# Altium project driver4ch.PrjPcb
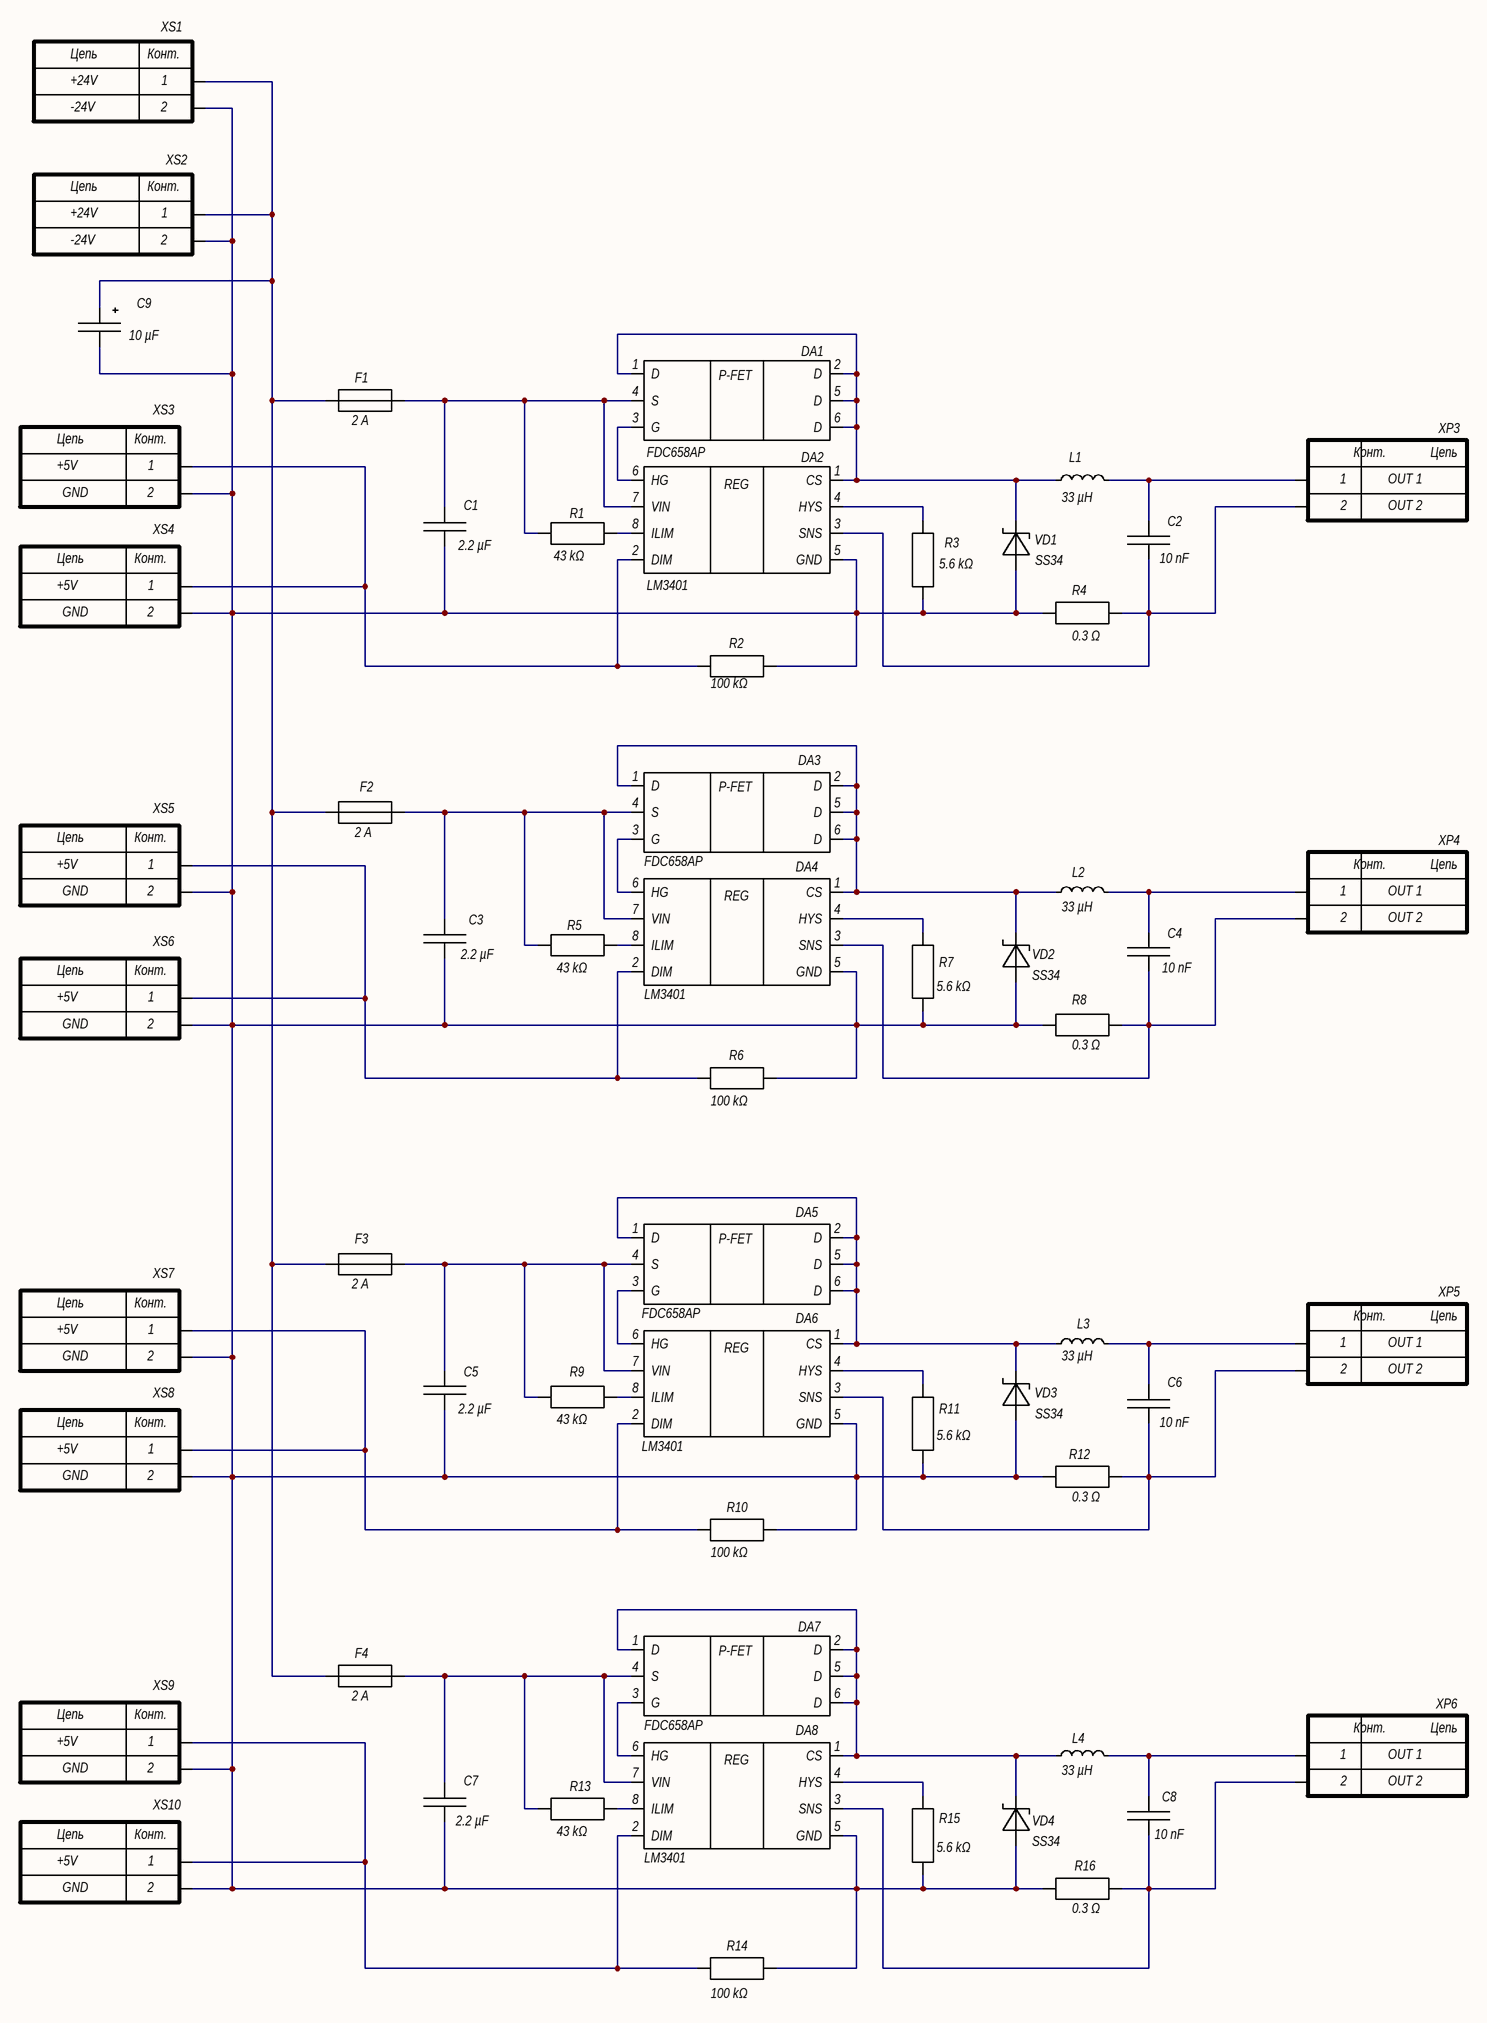
[diagram p0: driver4ch_E3_schematic.SchDoc]
1 sheet, 59 parts. Net scope: global (net labels, ports and power ports of the same name join across sheets).
Board file: driver4ch.PcbDoc

## Sheet driver4ch_E3_schematic.SchDoc
size 594 x 420 mm; CheckedBy: Нагорный А.В.; Author: Советников М.М.; CompanyName: ООО "Аксима"; Organization: ООО "Аксима"; SheetNumber: 1; SheetTotal: 1; Name1: 4-х канальный; Name2: драйвер

### Parts
C1  2.2 µF  [CAP 0805_2012 RF]
C2  10 nF  [CAP 0805_2012 RF]
C3  2.2 µF  [CAP 0805_2012 RF]
C4  10 nF  [CAP 0805_2012 RF]
C5  2.2 µF  [CAP 0805_2012 RF]
C6  10 nF  [CAP 0805_2012 RF]
C7  2.2 µF  [CAP 0805_2012 RF]
C8  10 nF  [CAP 0805_2012 RF]
C9  10 µF  [CAP ALSMD 6.6MM H5.4MM]
DA1  FDC658AP  [TI TSOT-23-6]
DA2  LM3401  [MSOP8]
DA3  FDC658AP  [TI TSOT-23-6]
DA4  LM3401  [MSOP8]
DA5  FDC658AP  [TI TSOT-23-6]
DA6  LM3401  [MSOP8]
DA7  FDC658AP  [TI TSOT-23-6]
DA8  LM3401  [MSOP8]
F1  2 A  [1206_fusE]
F2  2 A  [1206_fusE]
F3  2 A  [1206_fusE]
F4  2 A  [1206_fusE]
L1  33 µH  [INDUCTOR_1208]
L2  33 µH  [INDUCTOR_1208]
L3  33 µH  [INDUCTOR_1208]
L4  33 µH  [INDUCTOR_1208]
R1  43 kΩ  [RES 0805_2012]
R2  100 kΩ  [RES 0805_2012]
R3  5.6 kΩ  [RES 0805_2012]
R4  0.3 Ω  [RES 2512_6432]
R5  43 kΩ  [RES 0805_2012]
R6  100 kΩ  [RES 0805_2012]
R7  5.6 kΩ  [RES 0805_2012]
R8  0.3 Ω  [RES 2512_6432]
R9  43 kΩ  [RES 0805_2012]
R10  100 kΩ  [RES 0805_2012]
R11  5.6 kΩ  [RES 0805_2012]
R12  0.3 Ω  [RES 2512_6432]
R13  43 kΩ  [RES 0805_2012]
R14  100 kΩ  [RES 0805_2012]
R15  5.6 kΩ  [RES 0805_2012]
R16  0.3 Ω  [RES 2512_6432]
VD1  SS34  [DO214AC SMA]
VD2  SS34  [DO214AC SMA]
VD3  SS34  [DO214AC SMA]
VD4  SS34  [DO214AC SMA]
XP3  WB-02  [MW-2M]  (value not drawn)
XP4  WB-02  [MW-2M]  (value not drawn)
XP5  WB-02  [MW-2M]  (value not drawn)
XP6  WB-02  [MW-2M]  (value not drawn)
XS1  WK-02R  [CWF_2R]  (value not drawn)
XS2  WK-02R  [CWF_2R]  (value not drawn)
XS3  WB-02  [MW-2M]  (value not drawn)
XS4  WB-02  [MW-2M]  (value not drawn)
XS5  WB-02  [MW-2M]  (value not drawn)
XS6  WB-02  [MW-2M]  (value not drawn)
XS7  WB-02  [MW-2M]  (value not drawn)
XS8  WB-02  [MW-2M]  (value not drawn)
XS9  WB-02  [MW-2M]  (value not drawn)
XS10  WB-02  [MW-2M]  (value not drawn)

### Nets
NetC1_1: C1.1 C3.1 C5.1 C7.1 C9.1 DA2.5(GND) DA4.5(GND) DA6.5(GND) DA8.5(GND) R2.2 R3.1 R4.1 R6.2 R7.1 R8.1 R10.2 R11.1 R12.1 R14.2 R15.1 R16.1 VD1.1 VD2.1 VD3.1 VD4.1 XS1.2 XS2.2 XS3.2 XS4.2 XS5.2 XS6.2 XS7.2 XS8.2 XS9.2 XS10.2
NetC1_2: C1.2 DA1.4(S) DA2.7(VIN) F1.2 R1.1
NetC2_1: C2.1 DA2.3(SNS) R4.2 XP3.2
NetC2_2: C2.2 L1.2 XP3.1
NetC3_2: C3.2 DA3.4(S) DA4.7(VIN) F2.2 R5.1
NetC4_1: C4.1 DA4.3(SNS) R8.2 XP4.2
NetC4_2: C4.2 L2.2 XP4.1
NetC5_2: C5.2 DA5.4(S) DA6.7(VIN) F3.2 R9.1
NetC6_1: C6.1 DA6.3(SNS) R12.2 XP5.2
NetC6_2: C6.2 L3.2 XP5.1
NetC7_2: C7.2 DA7.4(S) DA8.7(VIN) F4.2 R13.1
NetC8_1: C8.1 DA8.3(SNS) R16.2 XP6.2
NetC8_2: C8.2 L4.2 XP6.1
NetC9_2: C9.2 F1.1 F2.1 F3.1 F4.1 XS1.1 XS2.1
NetDA1_1: DA1.1(D) DA1.2(D) DA1.5(D) DA1.6(D) DA2.1(CS) L1.1 VD1.2
NetDA1_3: DA1.3(G) DA2.6(HG)
NetDA2_2: DA2.2(DIM) R2.1 XS3.1 XS4.1
NetDA2_4: DA2.4(HYS) R3.2
NetDA2_8: DA2.8(ILIM) R1.2
NetDA3_1: DA3.1(D) DA3.2(D) DA3.5(D) DA3.6(D) DA4.1(CS) L2.1 VD2.2
NetDA3_3: DA3.3(G) DA4.6(HG)
NetDA4_2: DA4.2(DIM) R6.1 XS5.1 XS6.1
NetDA4_4: DA4.4(HYS) R7.2
NetDA4_8: DA4.8(ILIM) R5.2
NetDA5_1: DA5.1(D) DA5.2(D) DA5.5(D) DA5.6(D) DA6.1(CS) L3.1 VD3.2
NetDA5_3: DA5.3(G) DA6.6(HG)
NetDA6_2: DA6.2(DIM) R10.1 XS7.1 XS8.1
NetDA6_4: DA6.4(HYS) R11.2
NetDA6_8: DA6.8(ILIM) R9.2
NetDA7_1: DA7.1(D) DA7.2(D) DA7.5(D) DA7.6(D) DA8.1(CS) L4.1 VD4.2
NetDA7_3: DA7.3(G) DA8.6(HG)
NetDA8_2: DA8.2(DIM) R14.1 XS9.1 XS10.1
NetDA8_4: DA8.4(HYS) R15.2
NetDA8_8: DA8.8(ILIM) R13.2

### Notes on the sheet
- +24V
- -24V
- +5V
- GND
- OUT 1
- OUT 2
- Перв.примен.
- Справ.№
- Подп. и дата
- Инв.№ дубл.
- Взам.инв.№
- Подп.и дата
- Разраб.
- Изм.
- Лист
- № докум.
- Подп.
- Дата
- Лит.
- Масштаб
- Масса
- Т.контр.
- Пров.
- Листов
- Инв.№ подл.
- Утв.
- Н.контр.
- Нач.сект.
- Кафедра ИУ4
- МГТУ им. Н.Э. Баумана
- Копировал
- Формат А2
- (in symbol DA_LM3401) REG
- (in symbol VT_FDC658AP) P-FET
- (in symbol XP_Connector_2Pin) Конт.; Цепь
- (in symbol XS_Connector_2Pin) Цепь; Конт.

### Library data of the parts
C1 C3 C5 C7 = C_NonPolarized: Ceramic capacitor, 50 V, 10%; Value: 2.2 µF
C2 C4 C6 C8 = C_NonPolarized: Ceramic capacitor, 250 V, 10%; Value: 10 nF
C9 = C_Polarized: Aluminum electrolytic capacitor, 50 V, 20%; Value: 10 µF
DA1 DA3 DA5 DA7 = VT_FDC658AP: P-channel power MOSFET; Value: FDC658AP
DA2 DA4 DA6 DA8 = DA_LM3401: Hysteretic LED driver controller; Value: LM3401
F1-F4 = F_Fuse: Surface-mount fuse, 63 V; Value: 2 A
L1-L4 = L_Inductor: Shielded power inductor, 15%; Value: 33 µH
R1-R3 R5-R7 R9-R11 R13-R15 = R_Resistor: Chip resistor, 0.125 W
  R1 R5 R9 R13: Value: 43 kΩ
  R2 R6 R10 R14: Value: 100 kΩ
  R3 R7 R11 R15: Value: 5.6 kΩ
R4 R8 R12 R16 = R_Resistor: Current-sense resistor, 1 W, 1%; Value: 0.3 Ω
VD1-VD4 = VD_Schottky: Schottky rectifier, 3 A, 40 V; Value: SS34
XP3-XP6 = XP_Connector_2Pin: 2-pin connector; Value: WB-02
XS1 XS2 = XS_Connector_2Pin: 2-pin connector (socket); Value: WK-02R
XS3-XS10 = XS_Connector_2Pin: 2-pin connector; Value: WB-02